# Altium schematic sheet 11_CSI.SchDoc
size A; SheetNumber: 11; SheetTotal: 12
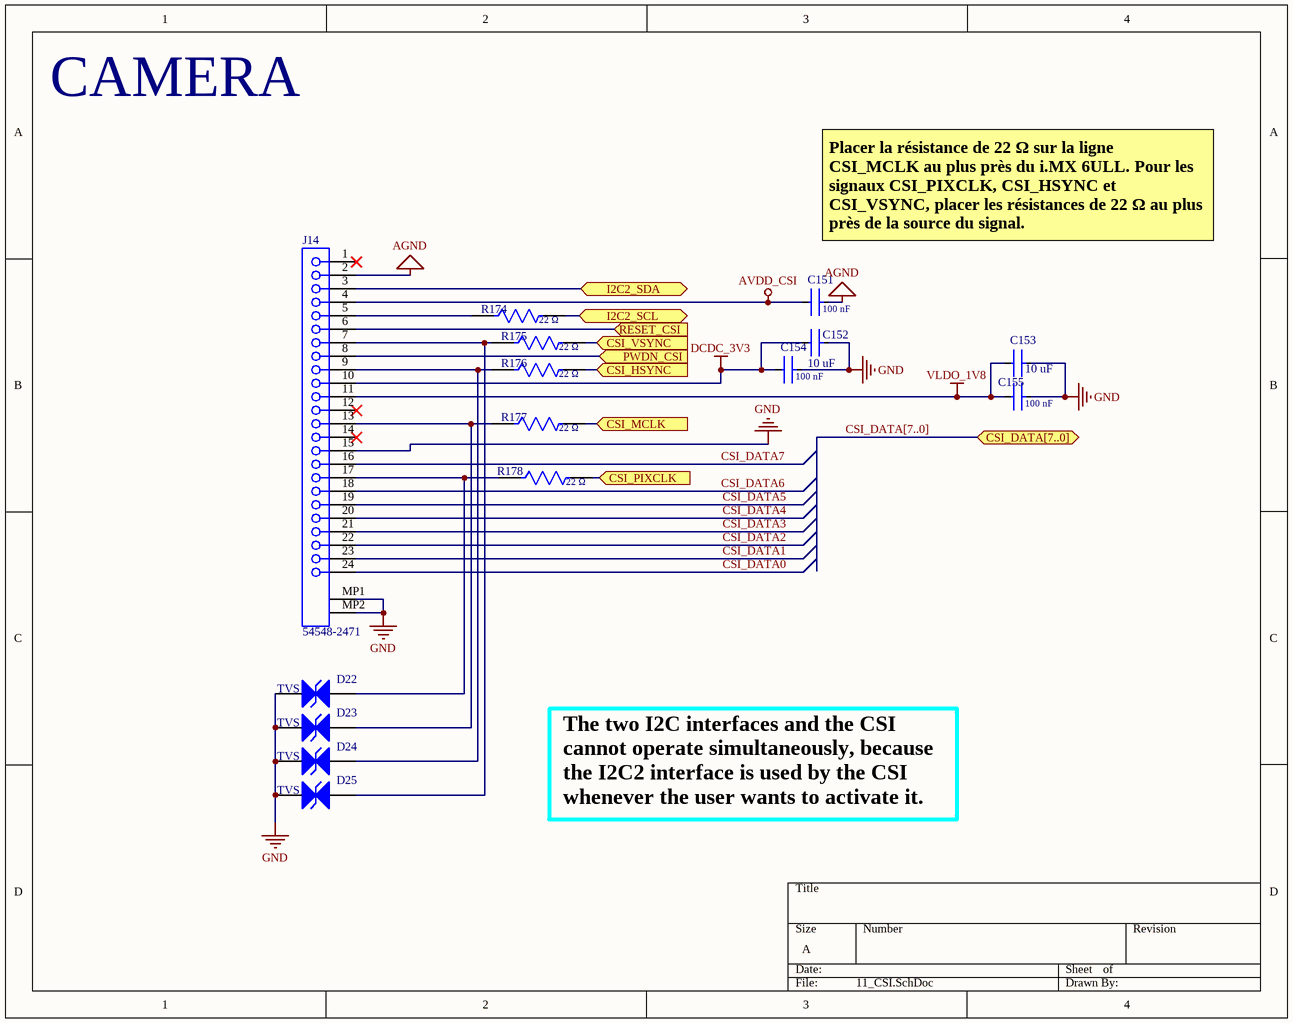
[diagram p0: 11_CSI.SchDoc]

## Parts
C151  100 nF  [FP-CC0603-DA-MFG]
C152  10 uF  [FP-GRM188-0_2-IPC_B]
C153  10 uF  [FP-GRM188-0_2-IPC_B]
C154  100 nF  [FP-CC0603-DA-MFG]
C155  100 nF  [FP-CC0603-DA-MFG]
D22  TVS  [WE-TVSP_DO-214AA_Bidirectional]
D23  TVS  [WE-TVSP_DO-214AA_Bidirectional]
D24  TVS  [WE-TVSP_DO-214AA_Bidirectional]
D25  TVS  [WE-TVSP_DO-214AA_Bidirectional]
J14  54548-2471  [MOLX-54548-2471]
R174  22 Ω  [FP-RC0603-0_55-IPC_C]
R175  22 Ω  [FP-RC0603-0_55-IPC_C]
R176  22 Ω  [FP-RC0603-0_55-IPC_C]
R177  22 Ω  [FP-RC0603-0_55-IPC_C]
R178  22 Ω  [FP-RC0603-0_55-IPC_C]

## Ports
CSI_DATA[7..0] (bidir), CSI_HSYNC (in), CSI_MCLK (in), CSI_PIXCLK (in), CSI_VSYNC (in), I2C2_SCL (bidir), I2C2_SDA (bidir), PWDN_CSI (in), RESET_CSI (in)

## Nets
AGND: C151.1 J14.2
AVDD_CSI: C151.2 J14.4
DCDC_3V3: C152.2 C154.2 J14.10
GND: C152.1 C153.1 C154.1 C155.1 D22.1 D23.1 D24.1 D25.1 J14.15 J14.MP1 J14.MP2
VLDO_1V8: C153.2 C155.2 J14.11
CSI_DATA0: J14.24
CSI_DATA1: J14.23
CSI_DATA2: J14.22
CSI_DATA3: J14.21
CSI_DATA4: J14.20
CSI_DATA5: J14.19
CSI_DATA6: J14.18
CSI_DATA7: J14.16
CSI_HSYNC: R176.2 ; port CSI_HSYNC
CSI_MCLK: R177.2 ; port CSI_MCLK
CSI_PIXCLK: R178.2 ; port CSI_PIXCLK
CSI_VSYNC: R175.2 ; port CSI_VSYNC
I2C2_SCL: R174.2 ; port I2C2_SCL
I2C2_SDA: J14.3 ; port I2C2_SDA
PWDN_CSI: J14.8 ; port PWDN_CSI
RESET_CSI: J14.6 ; port RESET_CSI
NetD22_2: D22.2 J14.17 R178.1
NetD23_2: D23.2 J14.13 R177.1
NetD24_2: D24.2 J14.9 R176.1
NetD25_2: D25.2 J14.7 R175.1
NetJ14_5: J14.5 R174.1

Not connected (* = marked no-connect by the designer): J14 1* 12* 14*

## Buses and harness runs
bus CSI_DATA[7..0] = port CSI_DATA[7..0]

## Notes on the sheet
- CAMERA
- Placer la résistance de 22 Ω sur la ligne CSI_MCLK au plus près du i.MX 6ULL. Pour les signaux CSI_PIXCLK, CSI_HSYNC et CSI_VSYNC, placer les résistances de 22 Ω au plus près de la source du signal.
- The two I2C interfaces and the CSI cannot operate simultaneously, because the I2C2 interface is used by the CSI whenever the user wants to activate it.

## Library data of the parts
C151 C154 C155 = CMP-2100-03601-2: CAP CER 0.1UF 50V X7R 0603; Manufacturer: YAGEO; Manufacturer Part Number: CC0603KRX7R9BB104; Material: Ceramic; Temperature Coefficient: 15%; Tolerance: 0.1; Height: 0.9mm; Voltage: 50 V; ComponentLink2Description: Datasheet; Device Class L2: Capacitors; Temperature Range High: +125°C; Category: Cap; Capacitance: 100 nF; Footprint Url: http://www.yageo.com/exep/pages/download/literatures/UPY-C_GEN_24.pdf; ComponentLink2URL: http://www.yageo.com/documents/recent/UPY-GPHC_X7R_6.3V-to-50V_18.pdf; Package: CC0603-DA; Temperature: -55°C to +125°C; Voltage Rating: 50 V; Temperature Characteristic: X7R; Device Class L1: Passive Components; Temperature Range Low: -55°C; RoHS: TRUE; Automotive: No; Value: 100 nF; Device Class L3: Ceramic Capacitors; Octopart: https://octopart.com/cc0603krx7r9bb104-yageo-42244635; Mouser Description: Multilayer Ceramic Capacitor, CC Series, 0.1 - F, - 10%, X7R, 50 V, 0603 [1608 Metric]; Lead Free: Yes; Digikey Description: CAP CER 0.1UF 50V X7R 0603
C152 C153 = CMP-06035-036920-1: Chip Multilayer Ceramic Capacitors for General Purpose, 0603, 10uF, X7R, 15%, 20%, 10V; Case/Package: 0603
D22-D25 = CMP-03913-71101643-2: TVS diode [Würth Elektronik] 824521751 TVS diode; Leakage Current: 1µA; Min Breakdown Voltage: 87.7V; Peak Pulse Power: 600W; Power Line Protection: No; Peak Pulse Current: 5A; Number of Bidirectional Channels: 1; Reverse Standoff Voltage: 75V; Clamping Voltage: 121V; Polarity: Bidirectional; Length: 4.32mm; Packaging: Cut Tape; Composition: Zener; Max Operating Temperature: 150°C; Breakdown Voltage: 87.7V; Height: 2.4mm; REACH SVHC: Unknown; Mount: Surface Mount; Number of Pins: 2; Min Operating Temperature: -65°C; Width: 3.62mm; Max Breakdown Voltage: 87.7V; RoHS: Compliant
J14 = CMP-1241-00556-1: 0.5 mm Pitch Easy-On(TM) Type FPC Connector, 1.2 mm Mated Height, Right Angle, ZIF, SMT, Bottom Contact, 24 Circuits, -20 to 85 degC, ELV and RoHS Compliant, Tape and Reel; Manufacturer: Molex; Current (Max per Contact): 0.5A; PCB Locator: No; Material - Plating Termination: Tin; Material - Plating Mating: Gold; PCB Retention: Yes; Circuits (Loaded): 24; Pitch - Mating Interface: 0.50mm; Material - Metal: Phosphor Bronze; Voltage (Max): 50V; Durability (mating cycles max): 20; Entry Angle: 90degrees Angle; Mated Height: 1.20mm; ComponentLink1Description: Manufacturer URL; PartNumber: 54548-2471; Packing: Tape and Reel; ComponentLink2Description: Datasheet; PackageVersion: Rev. N, 06/2008; Mounting Technology: Surface Mount; PackageReference: 54548-2471; Polarized to PCB: Yes; ComponentLink3URL: http://www.molex.com/pdm_docs/sd/545482471_sd.pdf; ComponentLink3Description: Package Specification; Contact Position: Bottom; Orientation: Right Angle; ComponentLink2URL: http://www.molex.com/webdocs/datasheets/pdf/en-us/0545482471_FFC_FPC_CONNECTORS.pdf; RoHS: TRUE; Stackable: No; ComponentLink1URL: http://www.molex.com/molex/index.jsp; PackageDescription: 24-Lead FPC Connector, Pitch 0.5 mm; Number of Rows: 1
R174-R178 = CMP-03412-037819-1: RES SMD 22 OHM 5% 1/10W 0603; Temperature Coefficient: 100ppm/°C; Max Power Dissipation: 100mW; Voltage Rating: 50V; Resistance: 22R; Length: 1.6mm; Tolerance: 5%; Resistance Tolerance: 5%; Number of Terminations: 2; Construction: Rectangular; Min Operating Temperature: -55°C; Lead Free: Lead Free; Width: 0.8mm; Case Code (Imperial): 0603; Voltage Rating (DC): 50V; Case/Package: 0603; Features: Moisture Resistant; REACH SVHC: No SVHC; Military Standard: Not; RoHS Compliant: Yes; Max Operating Temperature: 155°C; Number of Pins: 2; Termination: SMD/SMT; Case Code (Metric): 1608; Packaging: Tape and Reel; Resistor Type: Thick Film; Depth: 0.8mm; Size Code: 0603; Power Rating: 100mW; Series: RC